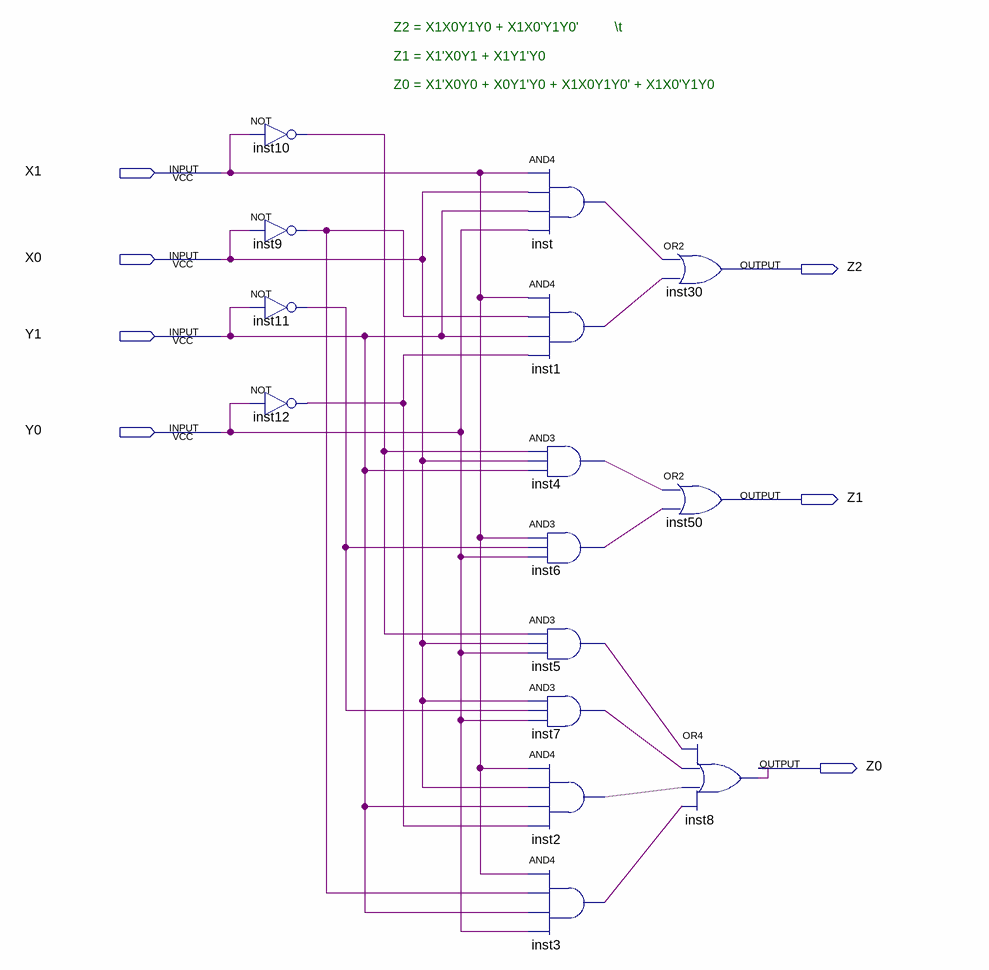
[diagram p0: schematic sheet]
// Quartus schematic Question3.bdf as structural Verilog: 15 symbols, 7 pins
module Question3 (
  input  X1,
  input  X0,
  input  Y1,
  input  Y0,
  output Z2,
  output Z1,
  output Z0
);

  wire inst1_out, inst2_out, inst3_out, inst4_out, inst5_out, inst6_out, inst7_out, inst9_out, inst10_out,
       inst11_out, inst12_out, inst_out;

  not inst10 (inst10_out, X1);
  not inst9 (inst9_out, X0);
  not inst11 (inst11_out, Y1);
  not inst12 (inst12_out, Y0);
  and inst (inst_out, X1, X0, Y1, Y0);
  and inst1 (inst1_out, X1, inst9_out, Y1, inst12_out);
  and inst4 (inst4_out, inst10_out, X0, Y1);
  and inst6 (inst6_out, X1, inst11_out, Y0);
  and inst5 (inst5_out, inst10_out, X0, Y0);
  and inst7 (inst7_out, X0, inst11_out, Y0);
  and inst2 (inst2_out, X1, X0, Y1, inst12_out);
  and inst3 (inst3_out, X1, inst9_out, Y1, Y0);
  or inst30 (Z2, inst_out, inst1_out);
  or inst50 (Z1, inst4_out, inst6_out);
  or inst8 (Z0, inst5_out, inst7_out, inst2_out, inst3_out);

  // Notes on the sheet:
  //   Z2 = X1X0Y1Y0 + X1X0'Y1Y0'         \t 
  //   Z1 = X1'X0Y1 + X1Y1'Y0                
  //   Z0 = X1'X0Y0 + X0Y1'Y0 + X1X0Y1Y0' + X1X0'Y1Y0                         
endmodule
